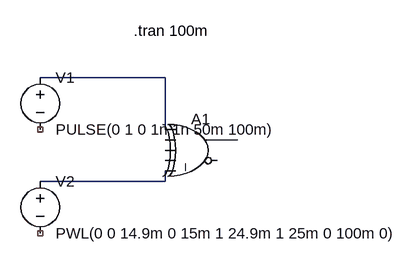
[diagram p0: schematic XOR.asc]
XOR.asc, the LTspice schematic file:
Version 4.1
SHEET 1 880 680
WIRE 208 96 16 96
WIRE 208 176 208 96
WIRE 320 192 272 192
WIRE 208 256 208 240
WIRE 208 256 16 256
SYMBOL voltage 16 80 R0
WINDOW 123 0 0 Left 0
WINDOW 39 0 0 Left 0
SYMATTR InstName V1
SYMATTR Value PULSE(0 1 0 1n 1n 50m 100m)
SYMBOL voltage 16 240 R0
WINDOW 123 0 0 Left 0
WINDOW 39 0 0 Left 0
SYMATTR InstName V2
SYMATTR Value PWL(0 0 14.9m 0 15m 1 24.9m 1 25m 0 100m 0)
SYMBOL Digital\\xor 256 144 R0
SYMATTR InstName A1
TEXT 160 24 Left 2 !.tran 100m

The netlist it stands for:
* XOR.asc
V1 N001 NC_01 PULSE(0 1 0 1n 1n 50m 100m)
V2 N003 NC_02 PWL(0 0 14.9m 0 15m 1 24.9m 1 25m 0 100m 0)
A1 N001 0 0 0 N003 0 N002 0 XOR
.tran 100m
.backanno
.end